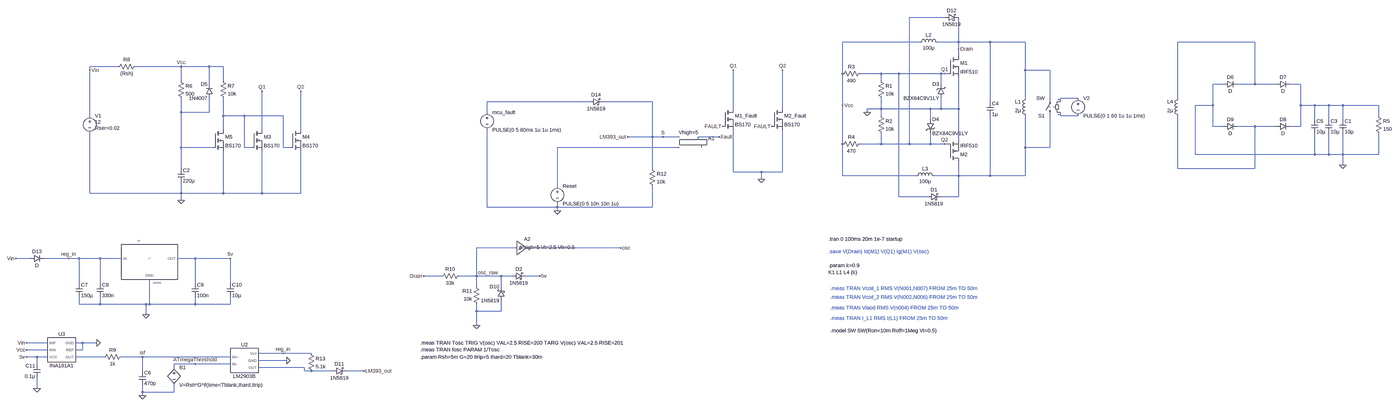
[diagram p0: schematic zvs_v06.asc, whole sheet]
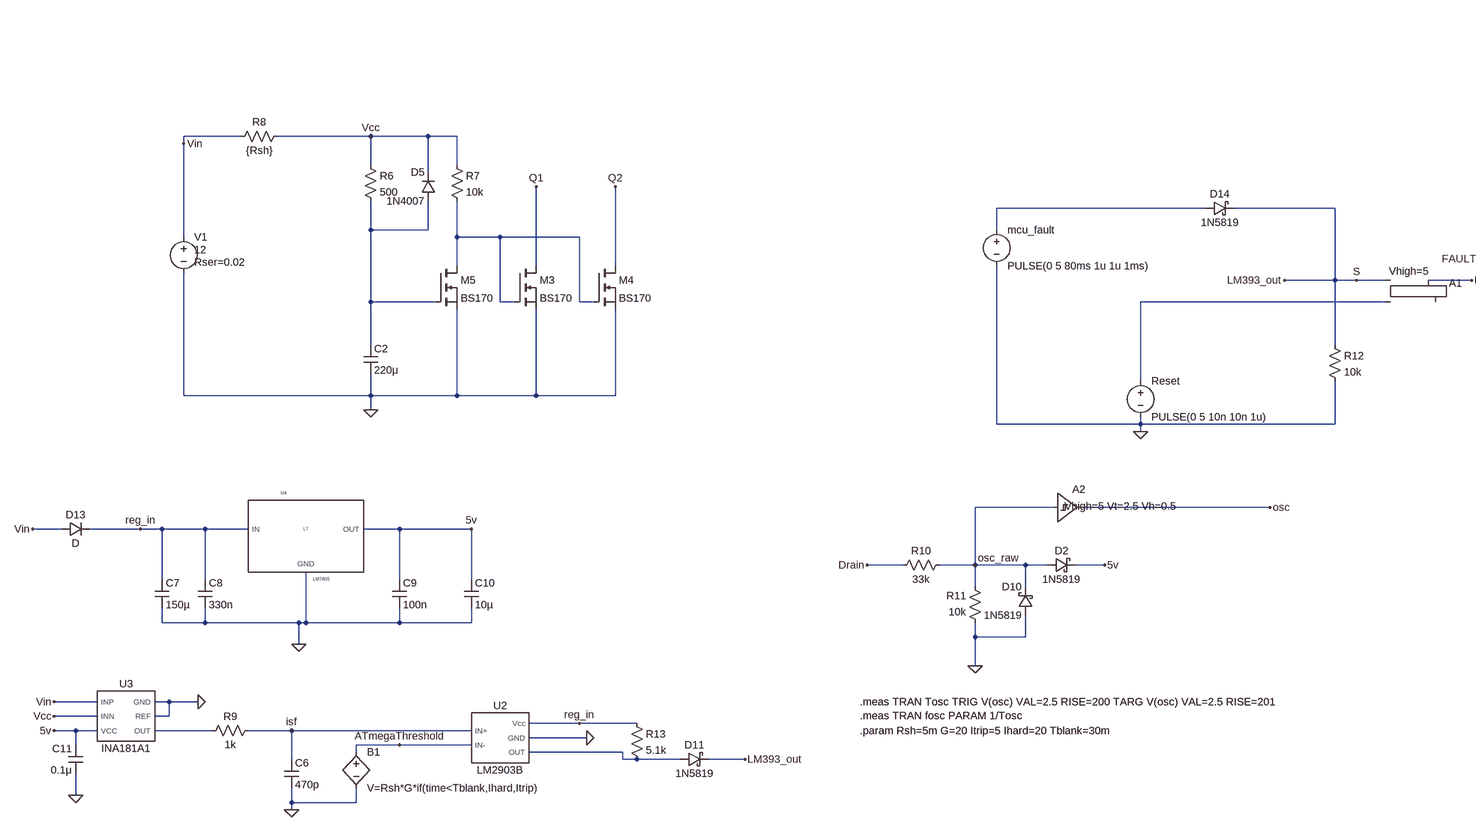
[diagram p1: schematic zvs_v06.asc, part, row 1 of 1, column 1 of 2]
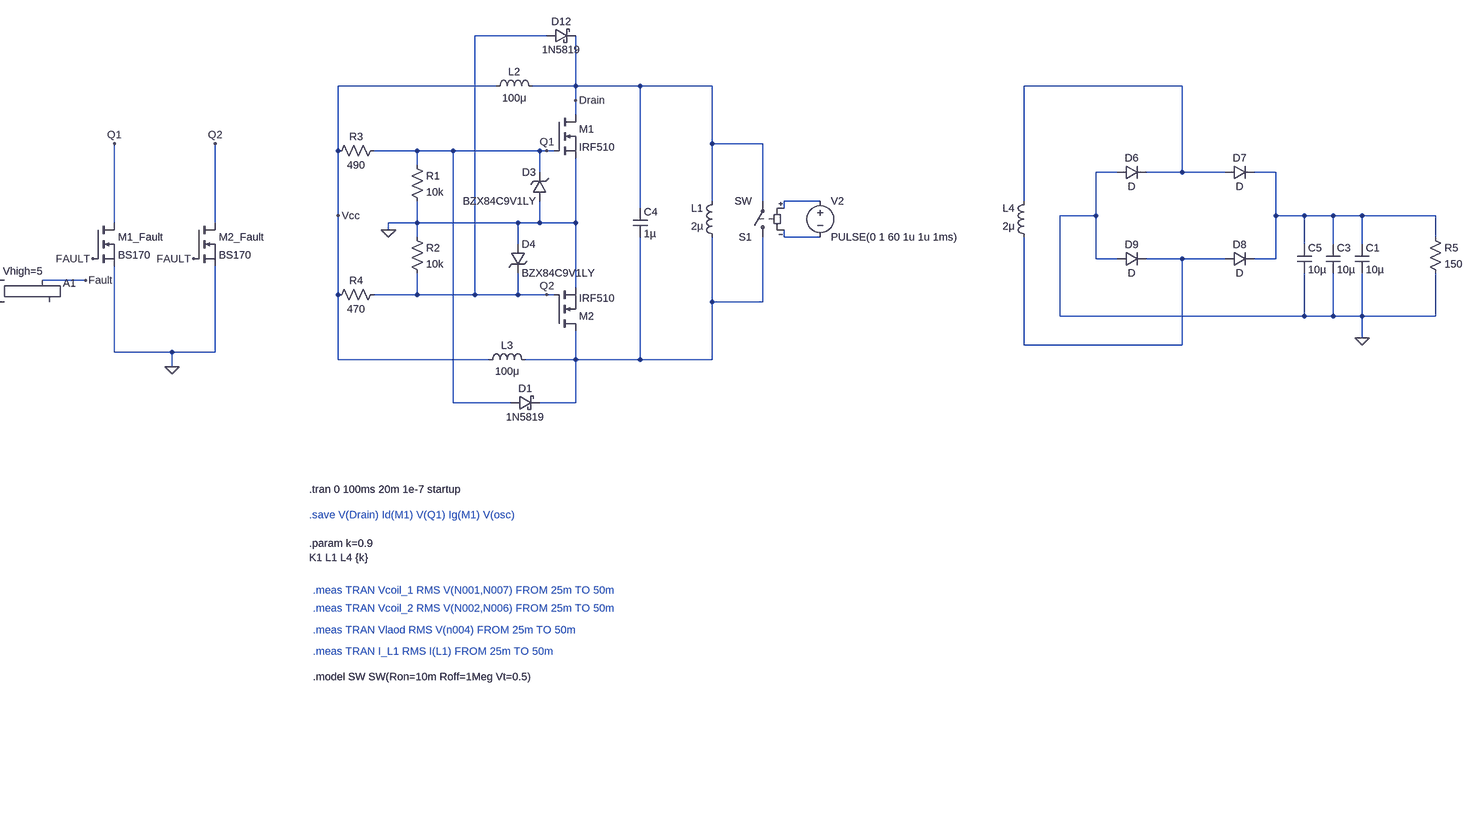
[diagram p2: schematic zvs_v06.asc, part, row 1 of 1, column 2 of 2]
zvs_v06.asc, the LTspice schematic file:
Version 4.1
SHEET 1 2644 1652
WIRE 96 -240 -64 -240
WIRE -16 -128 -368 -128
WIRE 160 -128 160 -240
WIRE 160 -128 64 -128
WIRE 304 -128 160 -128
WIRE 464 -128 304 -128
WIRE 1712 -128 1360 -128
WIRE 160 -96 160 -128
WIRE 160 -64 160 -96
WIRE -3712 -16 -3840 -16
WIRE -3424 -16 -3632 -16
WIRE -3296 -16 -3424 -16
WIRE -3232 -16 -3296 -16
WIRE -3840 0 -3840 -16
WIRE 464 0 464 -128
WIRE 576 0 464 0
WIRE -368 16 -368 -128
WIRE -192 16 -288 16
WIRE -112 16 -192 16
WIRE 80 16 -112 16
WIRE 96 16 80 16
WIRE 112 16 96 16
WIRE -3424 48 -3424 -16
WIRE -3232 48 -3232 -16
WIRE -192 48 -192 16
WIRE -3296 64 -3296 -16
WIRE 80 64 80 16
WIRE 1568 64 1520 64
WIRE 1712 64 1712 -128
WIRE 1712 64 1632 64
WIRE 1808 64 1712 64
WIRE 1920 64 1872 64
WIRE 464 128 464 0
WIRE 576 128 576 0
WIRE 704 128 624 128
WIRE 1360 128 1360 -128
WIRE -1568 144 -2032 144
WIRE -1280 144 -1504 144
WIRE 304 144 304 -128
WIRE 624 144 624 128
WIRE -368 160 -368 16
WIRE 1520 160 1520 64
WIRE 1520 160 1440 160
WIRE 1920 160 1920 64
WIRE 1984 160 1920 160
WIRE 2048 160 1984 160
WIRE 2112 160 2048 160
WIRE 2352 160 2112 160
WIRE -912 176 -912 0
WIRE -688 176 -688 0
WIRE -192 176 -192 128
WIRE -192 176 -256 176
WIRE 32 176 -192 176
WIRE 80 176 80 128
WIRE 80 176 32 176
WIRE 160 176 160 32
WIRE 160 176 80 176
WIRE -3424 192 -3424 128
WIRE -3296 192 -3296 128
WIRE -3296 192 -3424 192
WIRE -2032 192 -2032 144
WIRE -256 192 -256 176
WIRE -3840 208 -3840 0
WIRE -3232 208 -3232 128
WIRE -3136 208 -3232 208
WIRE -2960 208 -3136 208
WIRE -192 208 -192 176
WIRE 624 208 624 192
WIRE 704 208 624 208
WIRE 2352 208 2352 160
WIRE 32 224 32 176
WIRE 1984 224 1984 160
WIRE 2048 224 2048 160
WIRE 2112 224 2112 160
WIRE 1520 256 1520 160
WIRE 1568 256 1520 256
WIRE 1712 256 1632 256
WIRE 1808 256 1712 256
WIRE 1920 256 1920 160
WIRE 1920 256 1872 256
WIRE -3232 272 -3232 208
WIRE -3056 272 -3056 96
WIRE -2880 272 -2880 96
WIRE -1280 304 -1280 144
WIRE -1280 304 -1392 304
WIRE -1232 304 -1280 304
WIRE -1168 304 -1232 304
WIRE -976 304 -1072 304
WIRE 160 320 160 176
WIRE -368 336 -368 160
WIRE -192 336 -192 288
WIRE -192 336 -288 336
WIRE -64 336 -64 -240
WIRE -64 336 -192 336
WIRE 32 336 32 288
WIRE 32 336 -64 336
WIRE 96 336 32 336
WIRE 112 336 96 336
WIRE -3424 352 -3424 192
WIRE -3280 352 -3424 352
WIRE -3136 352 -3136 208
WIRE -3104 352 -3136 352
WIRE -2960 352 -2960 208
WIRE -2928 352 -2960 352
WIRE -1168 352 -1712 352
WIRE 464 352 464 208
WIRE 576 352 576 208
WIRE 576 352 464 352
WIRE 1440 384 1440 160
WIRE 1984 384 1984 288
WIRE 1984 384 1440 384
WIRE 2048 384 2048 288
WIRE 2048 384 1984 384
WIRE 2112 384 2112 288
WIRE 2112 384 2048 384
WIRE 2352 384 2352 288
WIRE 2352 384 2112 384
WIRE 2112 432 2112 384
WIRE -3424 448 -3424 352
WIRE -1280 448 -1280 304
WIRE 1360 448 1360 208
WIRE 1712 448 1712 256
WIRE 1712 448 1360 448
WIRE -912 464 -912 272
WIRE -784 464 -912 464
WIRE -688 464 -688 272
WIRE -688 464 -784 464
WIRE -368 480 -368 336
WIRE -32 480 -368 480
WIRE 160 480 160 416
WIRE 160 480 48 480
WIRE 304 480 304 208
WIRE 304 480 160 480
WIRE 464 480 464 352
WIRE 464 480 304 480
WIRE -784 496 -784 464
WIRE -1712 528 -1712 352
WIRE -3840 560 -3840 288
WIRE -3424 560 -3424 512
WIRE -3424 560 -3840 560
WIRE -3232 560 -3232 368
WIRE -3232 560 -3424 560
WIRE -3056 560 -3056 368
WIRE -3056 560 -3232 560
WIRE -2880 560 -2880 368
WIRE -2880 560 -3056 560
WIRE -112 576 -112 16
WIRE 16 576 -112 576
WIRE 160 576 160 480
WIRE 160 576 80 576
WIRE -3424 592 -3424 560
WIRE -2032 624 -2032 272
WIRE -1712 624 -1712 608
WIRE -1712 624 -2032 624
WIRE -1280 624 -1280 528
WIRE -1280 624 -1712 624
WIRE -1712 640 -1712 624
WIRE -1904 864 -2080 864
WIRE -1424 864 -1840 864
WIRE -4112 912 -4176 912
WIRE -3936 912 -4048 912
WIRE -3888 912 -3936 912
WIRE -3792 912 -3888 912
WIRE -3696 912 -3792 912
WIRE -3360 912 -3440 912
WIRE -3200 912 -3360 912
WIRE -2240 992 -2320 992
WIRE -2080 992 -2080 864
WIRE -2080 992 -2160 992
WIRE -1968 992 -2080 992
WIRE -1920 992 -1968 992
WIRE -1792 992 -1856 992
WIRE -3888 1024 -3888 912
WIRE -3792 1024 -3792 912
WIRE -3360 1024 -3360 912
WIRE -3200 1024 -3200 912
WIRE -2080 1040 -2080 992
WIRE -1968 1040 -1968 992
WIRE -3888 1120 -3888 1088
WIRE -3792 1120 -3792 1088
WIRE -3792 1120 -3888 1120
WIRE -3584 1120 -3792 1120
WIRE -3568 1120 -3568 1008
WIRE -3568 1120 -3584 1120
WIRE -3360 1120 -3360 1088
WIRE -3360 1120 -3568 1120
WIRE -3200 1120 -3200 1088
WIRE -3200 1120 -3360 1120
WIRE -2080 1152 -2080 1120
WIRE -1968 1152 -1968 1104
WIRE -1968 1152 -2080 1152
WIRE -3584 1168 -3584 1120
WIRE -2080 1216 -2080 1152
WIRE -4032 1296 -4128 1296
WIRE -3872 1296 -3904 1296
WIRE -3808 1296 -3872 1296
WIRE -4032 1328 -4128 1328
WIRE -3872 1328 -3872 1296
WIRE -3872 1328 -3904 1328
WIRE -2960 1344 -3072 1344
WIRE -2832 1344 -2960 1344
WIRE -4080 1360 -4128 1360
WIRE -4032 1360 -4080 1360
WIRE -3776 1360 -3904 1360
WIRE -3600 1360 -3696 1360
WIRE -3200 1360 -3600 1360
WIRE -2944 1376 -3072 1376
WIRE -4080 1392 -4080 1360
WIRE -3360 1392 -3456 1392
WIRE -3200 1392 -3360 1392
WIRE -3456 1408 -3456 1392
WIRE -2864 1408 -3072 1408
WIRE -3600 1424 -3600 1360
WIRE -2864 1424 -2864 1408
WIRE -2832 1424 -2864 1424
WIRE -2736 1424 -2832 1424
WIRE -2592 1424 -2672 1424
WIRE -4080 1504 -4080 1456
WIRE -3600 1520 -3600 1488
WIRE -3456 1520 -3456 1488
WIRE -3456 1520 -3600 1520
WIRE -3600 1536 -3600 1520
FLAG -256 192 0
FLAG -3424 592 0
FLAG -3056 96 Q1
FLAG -2880 96 Q2
FLAG 96 16 Q1
FLAG 96 336 Q2
FLAG 2112 432 0
FLAG -3424 -16 Vcc
FLAG -368 160 Vcc
FLAG -912 0 Q1
FLAG -688 0 Q2
FLAG -960 256 FAULT
FLAG -736 256 FAULT
FLAG -3840 0 Vin
FLAG -976 304 Fault
FLAG -3600 1360 isf
FLAG -784 496 0
FLAG -1712 640 0
FLAG 160 -96 Drain
FLAG -2320 992 Drain
FLAG -2080 1216 0
FLAG -2080 992 osc_raw
FLAG -1424 864 osc
FLAG -4176 912 Vin
FLAG -3936 912 reg_in
FLAG -3584 1168 0
FLAG -3200 912 5v
FLAG -4128 1360 5v
FLAG -3808 1296 0
FLAG -3600 1536 0
FLAG -4128 1296 Vin
FLAG -4128 1328 Vcc
FLAG -1792 992 5v
FLAG -2960 1344 reg_in
FLAG -2944 1376 0
FLAG -2592 1424 LM393_out
FLAG -1392 304 LM393_out
FLAG -3360 1392 ATmegaThreshold
FLAG -1232 304 S
FLAG -4080 1504 0
SYMBOL ind 480 224 R180
WINDOW 0 36 80 Left 2
WINDOW 3 36 40 Left 2
SYMATTR InstName L1
SYMATTR Value 2µ
SYMATTR SpiceLine Rser=0.1
SYMATTR Type ind
SYMBOL ind -32 -112 R270
WINDOW 0 32 56 VTop 2
WINDOW 3 5 56 VBottom 2
SYMATTR InstName L2
SYMATTR Value 100μ
SYMBOL ind -48 496 R270
WINDOW 0 32 56 VTop 2
WINDOW 3 5 56 VBottom 2
SYMATTR InstName L3
SYMATTR Value 100μ
SYMBOL res -208 32 R0
SYMATTR InstName R1
SYMATTR Value 10k
SYMATTR SpiceLine tol=1 pwr=0.6
SYMBOL res -208 192 R0
SYMATTR InstName R2
SYMATTR Value 10k
SYMATTR SpiceLine tol=1 pwr=0.6
SYMBOL res -272 0 R90
WINDOW 0 0 56 VBottom 2
WINDOW 3 32 56 VTop 2
SYMATTR InstName R3
SYMATTR Value 490
SYMATTR SpiceLine tol=1 pwr=0.6
SYMBOL res -272 320 R90
WINDOW 0 0 56 VBottom 2
WINDOW 3 32 56 VTop 2
SYMATTR InstName R4
SYMATTR Value 470
SYMATTR SpiceLine tol=1 pwr=0.6
SYMBOL voltage -3840 192 R0
WINDOW 123 0 0 Left 0
WINDOW 39 24 72 Left 2
WINDOW 3 24 44 Left 2
SYMATTR SpiceLine Rser=0.02
SYMATTR Value 12
SYMATTR InstName V1
SYMBOL res -3440 32 R0
SYMATTR InstName R6
SYMATTR Value 500
SYMATTR SpiceLine tol=1 pwr=0.6
SYMBOL res -3248 32 R0
SYMATTR InstName R7
SYMATTR Value 10k
SYMATTR SpiceLine tol=1 pwr=0.6
SYMBOL cap -3440 448 R0
SYMATTR InstName C2
SYMATTR Value 220μ
SYMATTR SpiceLine Rser=0.1
SYMBOL cap 288 144 R0
SYMATTR InstName C4
SYMATTR Value 1µ
SYMATTR SpiceLine V=1K Irms=0 Rser=0 Lser=0
SYMBOL diode -3280 128 R180
WINDOW 0 24 64 Left 2
WINDOW 3 24 0 Left 2
SYMATTR InstName D5
SYMATTR Value 1N4007
SYMBOL nmos -3280 272 R0
SYMATTR InstName M5
SYMATTR Value BS170
SYMBOL zener 96 128 R180
WINDOW 0 24 64 Left 2
WINDOW 3 24 0 Left 2
SYMATTR InstName D3
SYMATTR Value BZX84C9V1LY
SYMBOL zener 16 224 R0
SYMATTR InstName D4
SYMATTR Value BZX84C9V1LY
SYMBOL nmos 112 -64 R0
SYMATTR InstName M1
SYMATTR Value IRF510
SYMBOL schottky 96 -224 R270
WINDOW 0 32 32 VTop 2
WINDOW 3 0 32 VBottom 2
SYMATTR InstName D12
SYMATTR Value 1N5819
SYMBOL schottky 16 592 R270
WINDOW 0 32 32 VTop 2
WINDOW 3 0 32 VBottom 2
SYMATTR InstName D1
SYMATTR Value 1N5819
SYMBOL nmos -3104 272 R0
SYMATTR InstName M3
SYMATTR Value BS170
SYMBOL nmos -2928 272 R0
SYMATTR InstName M4
SYMATTR Value BS170
SYMBOL nmos 112 416 M180
SYMATTR InstName M2
SYMATTR Value IRF510
SYMBOL ind 1376 224 R180
WINDOW 0 36 80 Left 2
WINDOW 3 36 40 Left 2
SYMATTR InstName L4
SYMATTR Value 2μ
SYMATTR SpiceLine Rser=0.1
SYMATTR Type ind
SYMBOL res 2336 192 R0
SYMATTR InstName R5
SYMATTR Value 150
SYMATTR SpiceLine tol=1 pwr=0.6
SYMBOL cap 2096 224 R0
SYMATTR InstName C1
SYMATTR Value 10µ
SYMATTR SpiceLine V=100 Rser=0.1
SYMBOL cap 2032 224 R0
SYMATTR InstName C3
SYMATTR Value 10µ
SYMATTR SpiceLine V=100 Rser=0.1
SYMBOL cap 1968 224 R0
SYMATTR InstName C5
SYMATTR Value 10µ
SYMATTR SpiceLine V=100 Rser=0.1
SYMBOL diode 1568 80 R270
WINDOW 0 32 32 VTop 2
WINDOW 3 0 32 VBottom 2
SYMATTR InstName D6
SYMBOL diode 1808 80 R270
WINDOW 0 32 32 VTop 2
WINDOW 3 0 32 VBottom 2
SYMATTR InstName D7
SYMBOL diode 1808 272 R270
WINDOW 0 32 32 VTop 2
WINDOW 3 0 32 VBottom 2
SYMATTR InstName D8
SYMBOL diode 1568 272 R270
WINDOW 0 32 32 VTop 2
WINDOW 3 0 32 VBottom 2
SYMATTR InstName D9
SYMBOL nmos -960 176 R0
SYMATTR InstName M1_Fault
SYMATTR Value BS170
SYMBOL nmos -736 176 R0
SYMATTR InstName M2_Fault
SYMATTR Value BS170
SYMBOL res -3616 -32 R90
WINDOW 0 0 56 VBottom 2
WINDOW 3 32 56 VTop 2
SYMATTR InstName R8
SYMATTR Value {Rsh}
SYMBOL res -3792 1376 R270
WINDOW 0 32 56 VTop 2
WINDOW 3 0 56 VBottom 2
SYMATTR InstName R9
SYMATTR Value 1k
SYMBOL cap -3616 1424 R0
SYMATTR InstName C6
SYMATTR Value 470p
SYMBOL Digital\\srflop -1120 256 R0
WINDOW 3 -40 28 Left 2
SYMATTR Value Vhigh=5
SYMATTR InstName A1
SYMBOL sw 576 224 R180
SYMATTR InstName S1
SYMBOL voltage 704 112 R0
WINDOW 123 0 0 Left 0
WINDOW 39 0 0 Left 0
SYMATTR InstName V2
SYMATTR Value PULSE(0 1 60 1u 1u 1ms)
SYMBOL voltage -1712 512 R0
WINDOW 123 0 0 Left 0
WINDOW 39 0 0 Left 0
SYMATTR InstName Reset
SYMATTR Value PULSE(0 5 10n 10n 1u)
SYMBOL res -2144 976 R90
WINDOW 0 0 56 VBottom 2
WINDOW 3 32 56 VTop 2
SYMATTR InstName R10
SYMATTR Value 33k
SYMBOL res -2064 1136 R180
WINDOW 0 36 76 Left 2
WINDOW 3 36 40 Left 2
SYMATTR InstName R11
SYMATTR Value 10k
SYMBOL schottky -1920 1008 R270
WINDOW 0 32 32 VTop 2
WINDOW 3 0 32 VBottom 2
SYMATTR InstName D2
SYMATTR Value 1N5819
SYMATTR Description Diode
SYMATTR Type diode
SYMBOL schottky -1952 1104 R180
WINDOW 0 24 64 Left 2
WINDOW 3 24 0 Left 2
SYMATTR InstName D10
SYMATTR Value 1N5819
SYMATTR Description Diode
SYMATTR Type diode
SYMBOL Digital\\schmtbuf -1904 800 R0
WINDOW 3 148 46 Top 2
SYMATTR Value Vhigh=5 Vt=2.5 Vh=0.5
SYMATTR InstName A2
SYMBOL schottky -2736 1440 R270
WINDOW 0 32 32 VTop 2
WINDOW 3 0 32 VBottom 2
SYMATTR InstName D11
SYMATTR Value 1N5819
SYMATTR Description Diode
SYMATTR Type diode
SYMBOL res -1296 432 R0
SYMATTR InstName R12
SYMATTR Value 10k
SYMBOL voltage -2032 176 R0
WINDOW 123 0 0 Left 0
WINDOW 39 0 0 Left 0
SYMATTR InstName mcu_fault
SYMATTR Value PULSE(0 5 80ms 1u 1u 1ms)
SYMBOL diode -4112 928 R270
WINDOW 0 32 32 VTop 2
WINDOW 3 0 32 VBottom 2
SYMATTR InstName D13
SYMBOL cap -3904 1024 R0
SYMATTR InstName C7
SYMATTR Value 150µ
SYMBOL cap -3808 1024 R0
SYMATTR InstName C8
SYMATTR Value 330n
SYMBOL cap -3376 1024 R0
SYMATTR InstName C9
SYMATTR Value 100n
SYMBOL cap -3216 1024 R0
SYMATTR InstName C10
SYMATTR Value 10µ
SYMBOL INA181A1 -3968 1328 R0
SYMATTR InstName U3
SYMBOL schottky -1568 160 R270
WINDOW 0 32 32 VTop 2
WINDOW 3 0 32 VBottom 2
SYMATTR InstName D14
SYMATTR Value 1N5819
SYMATTR Description Diode
SYMATTR Type diode
SYMBOL LM2903B -3136 1376 R0
SYMATTR InstName U2
SYMBOL res -2848 1328 R0
SYMATTR InstName R13
SYMATTR Value 5.1k
SYMBOL 7805 -3568 912 R0
SYMATTR InstName U4
SYMBOL bv -3456 1392 R0
SYMATTR InstName B1
SYMATTR Value V=Rsh*G*if(time<Tblank,Ihard,Itrip)
SYMBOL cap -4064 1456 R180
WINDOW 0 24 56 Left 2
WINDOW 3 24 8 Left 2
SYMATTR InstName C11
SYMATTR Value 0.1μ
TEXT -432 824 Left 2 !.tran 0 100ms 20m 1e-7 startup
TEXT -432 880 Left 2 ;.save V(Drain) Id(M1) V(Q1) Ig(M1) V(osc)
TEXT -432 944 Left 2 !.param k=0.9\nK1 L1 L4 {k}
TEXT -424 1048 Left 2 ;.meas TRAN Vcoil_1 RMS V(N001,N007) FROM 25m TO 50m
TEXT -424 1088 Left 2 ;.meas TRAN Vcoil_2 RMS V(N002,N006) FROM 25m TO 50m
TEXT -424 1136 Left 2 ;.meas TRAN Vlaod RMS V(n004) FROM 25m TO 50m
TEXT -424 1184 Left 2 ;.meas TRAN I_L1 RMS I(L1) FROM 25m TO 50m
TEXT -2336 1360 Left 2 !.param Rsh=5m G=20 Itrip=5 Ihard=20 Tblank=30m
TEXT -424 1240 Left 2 !.model SW SW(Ron=10m Roff=1Meg Vt=0.5)
TEXT -2336 1296 Left 2 !.meas TRAN Tosc TRIG V(osc) VAL=2.5 RISE=200 TARG V(osc) VAL=2.5 RISE=201\n.meas TRAN fosc PARAM 1/Tosc

The netlist it stands for:
* zvs_v06.asc
L1 N010 Drain 2µ Rser=0.1
L2 Vcc Drain 100μ
L3 Vcc N010 100μ
R1 Q1 0 10k tol=1 pwr=0.6
R2 0 Q2 10k tol=1 pwr=0.6
R3 Q1 Vcc 490 tol=1 pwr=0.6
R4 Q2 Vcc 470 tol=1 pwr=0.6
V1 Vin 0 12 Rser=0.02
R6 Vcc N005 500 tol=1 pwr=0.6
R7 Vcc N006 10k tol=1 pwr=0.6
C2 N005 0 220μ Rser=0.1
C4 Drain N010 1µ V=1K Irms=0 Rser=0 Lser=0
D5 N005 Vcc 1N4007
M5 N006 N005 0 0 BS170
D3 0 Q1 BZX84C9V1LY
D4 0 Q2 BZX84C9V1LY
M1 Drain Q1 0 0 IRF510
D12 Q2 Drain 1N5819
D1 Q1 N010 1N5819
M3 Q1 N006 0 0 BS170
M4 Q2 N006 0 0 BS170
M2 N010 Q2 0 0 IRF510
L4 N008 N001 2μ Rser=0.1
R5 N002 0 150 tol=1 pwr=0.6
C1 N002 0 10µ V=100 Rser=0.1
C3 N002 0 10µ V=100 Rser=0.1
C5 N002 0 10µ V=100 Rser=0.1
D6 0 N001 D
D7 N001 N002 D
D8 N008 N002 D
D9 0 N008 D
M1_Fault Q1 FAULT 0 0 BS170
M2_Fault Q2 FAULT 0 0 BS170
R8 Vcc Vin {Rsh}
R9 N011 isf 1k
C6 isf 0 470p
A1 S N009 0 0 0 0 FAULT 0 SRFLOP Vhigh=5
S1 N010 Drain N003 N007 SW
V2 N003 N007 PULSE(0 1 60 1u 1u 1ms)
V§Reset N009 0 PULSE(0 5 10n 10n 1u)
R10 osc_raw Drain 33k
R11 0 osc_raw 10k
D2 osc_raw 5v 1N5819
D10 0 osc_raw 1N5819
A2 osc_raw 0 0 0 0 0 osc 0 SCHMITT Vhigh=5 Vt=2.5 Vh=0.5
D11 N012 S 1N5819
R12 S 0 10k
V§mcu_fault N004 0 PULSE(0 5 80ms 1u 1u 1ms)
D13 Vin reg_in D
C7 reg_in 0 150µ
C8 reg_in 0 330n
C9 5v 0 100n
C10 5v 0 10µ
X§U3 Vin Vcc 5v 0 0 N011 INA181A1  ; pins INP INN VCC GND REF OUT
D14 N004 S 1N5819
X§U2 isf ATmegaThreshold reg_in 0 N012 LM2903B  ; pins IN+ IN- Vcc GND OUT
R13 reg_in N012 5.1k
X§U4 reg_in 0 5v LM7805  ; pins IN GND OUT
B1 ATmegaThreshold 0 V=Rsh*G*if(time<Tblank,Ihard,Itrip)
C11 0 5v 0.1μ
.model D D
.lib standard.dio
.model NMOS NMOS
.model PMOS PMOS
.lib standard.mos
.tran 0 100ms 20m 1e-7 startup
* .save V(Drain) Id(M1) V(Q1) Ig(M1) V(osc)
.param k=0.9
K1 L1 L4 {k}
* .meas TRAN Vcoil_1 RMS V(N001,N007) FROM 25m TO 50m
* .meas TRAN Vcoil_2 RMS V(N002,N006) FROM 25m TO 50m
* .meas TRAN Vlaod RMS V(n004) FROM 25m TO 50m
* .meas TRAN I_L1 RMS I(L1) FROM 25m TO 50m
.param Rsh=5m G=20 Itrip=5 Ihard=20 Tblank=30m
.model SW SW(Ron=10m Roff=1Meg Vt=0.5)
.meas TRAN Tosc TRIG V(osc) VAL=2.5 RISE=200 TARG V(osc) VAL=2.5 RISE=201
.meas TRAN fosc PARAM 1/Tosc
.lib ina181a1.lib
.lib lm393.lib
.lib regulators.lib
.backanno
.end